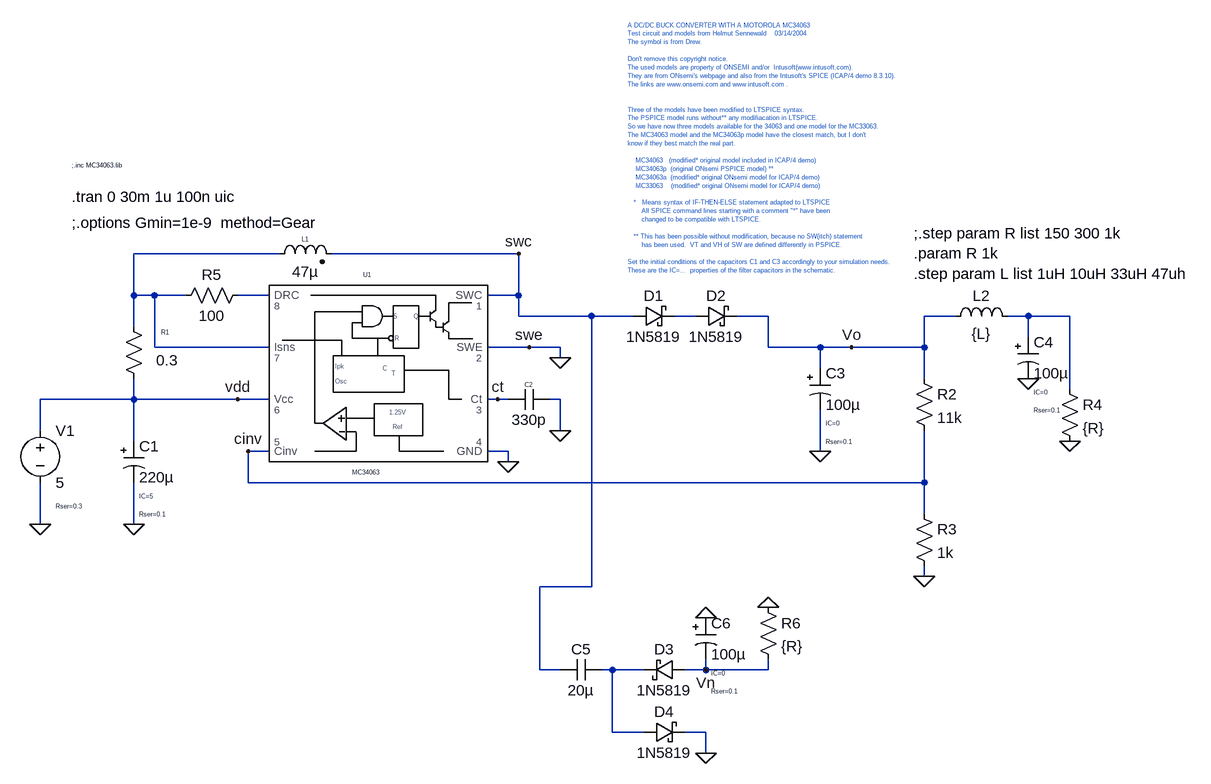
[diagram p0: schematic MC34063_boost_and_negative_rail.asc]
MC34063_boost_and_negative_rail.asc, the LTspice schematic file:
Version 4
SHEET 1 1980 852
WIRE -48 64 -272 64
WIRE 320 64 32 64
WIRE -272 128 -272 64
WIRE -240 128 -272 128
WIRE -192 128 -240 128
WIRE -64 128 -112 128
WIRE 320 128 320 64
WIRE 320 128 272 128
WIRE 320 160 320 128
WIRE 432 160 320 160
WIRE 496 160 432 160
WIRE 592 160 560 160
WIRE 704 160 656 160
WIRE 992 160 944 160
WIRE 1104 160 1072 160
WIRE 1168 160 1104 160
WIRE -272 176 -272 128
WIRE 1104 192 1104 160
WIRE -240 208 -240 128
WIRE -64 208 -240 208
WIRE 336 208 272 208
WIRE 384 208 336 208
WIRE 704 208 704 160
WIRE 784 208 704 208
WIRE 832 208 784 208
WIRE 944 208 944 160
WIRE 944 208 832 208
WIRE 384 224 384 208
WIRE 784 240 784 208
WIRE 944 256 944 208
WIRE 1168 272 1168 160
WIRE -272 288 -272 256
WIRE -272 288 -416 288
WIRE -112 288 -272 288
WIRE -64 288 -112 288
WIRE 288 288 272 288
WIRE 304 288 288 288
WIRE 384 288 368 288
WIRE -416 336 -416 288
WIRE 384 336 384 288
WIRE -272 352 -272 288
WIRE -64 368 -96 368
WIRE 304 368 272 368
WIRE 784 368 784 304
WIRE 304 384 304 368
WIRE -96 416 -96 368
WIRE 944 416 944 336
WIRE 944 416 -96 416
WIRE 944 464 944 416
WIRE -416 480 -416 416
WIRE -272 480 -272 416
WIRE 944 560 944 544
WIRE 432 576 432 160
WIRE 432 576 352 576
WIRE 352 704 352 576
WIRE 384 704 352 704
WIRE 464 704 448 704
WIRE 512 704 464 704
WIRE 608 704 608 688
WIRE 608 704 576 704
WIRE 704 704 704 688
WIRE 704 704 608 704
WIRE 464 800 464 704
WIRE 512 800 464 800
WIRE 608 800 576 800
WIRE 608 832 608 800
FLAG -416 480 0
FLAG -272 480 0
FLAG 384 336 0
FLAG 784 368 0
FLAG 832 208 Vo
FLAG 944 560 0
FLAG 304 384 0
FLAG 288 288 ct
FLAG 336 208 swe
FLAG -112 288 vdd
FLAG -96 368 cinv
FLAG 320 64 swc
FLAG 384 224 0
FLAG 1168 352 0
FLAG 1104 256 0
FLAG 608 832 0
FLAG 608 624 0
FLAG 608 704 Vn
FLAG 704 608 0
SYMBOL voltage -416 320 R0
WINDOW 123 0 0 Left 0
WINDOW 39 24 132 Left 0
SYMATTR SpiceLine Rser=0.3
SYMATTR InstName V1
SYMATTR Value 5
SYMBOL res -256 272 R180
WINDOW 0 -39 87 Left 0
WINDOW 3 -52 44 Left 2
SYMATTR InstName R1
SYMATTR Value 0.3
SYMBOL cap 304 304 R270
WINDOW 0 32 32 VTop 0
WINDOW 3 0 32 VBottom 2
SYMATTR InstName C2
SYMATTR Value 330p
SYMBOL schottky 496 176 R270
WINDOW 0 32 32 VTop 2
WINDOW 3 0 32 VBottom 2
SYMATTR InstName D1
SYMATTR Value 1N5819
SYMATTR Description Diode
SYMATTR Type diode
SYMBOL ind2 -64 80 R270
WINDOW 0 32 56 VTop 0
WINDOW 3 4 56 VBottom 2
SYMATTR InstName L1
SYMATTR Value 47µ
SYMATTR SpiceLine Rser=0.5
SYMATTR Type ind
SYMBOL res 928 240 R0
SYMATTR InstName R2
SYMATTR Value 11k
SYMBOL res 928 448 R0
SYMATTR InstName R3
SYMATTR Value 1k
SYMBOL polcap 768 240 R0
WINDOW 39 24 113 Left 0
WINDOW 40 24 85 Left 0
SYMATTR SpiceLine Rser=0.1
SYMATTR SpiceLine2 IC=0
SYMATTR InstName C3
SYMATTR Value 100µ
SYMBOL polcap -288 352 R0
WINDOW 39 24 113 Left 0
WINDOW 40 24 85 Left 0
SYMATTR SpiceLine Rser=0.1
SYMATTR SpiceLine2 IC=5
SYMATTR InstName C1
SYMATTR Value 220µ
SYMBOL MC34063 176 224 R0
SYMATTR InstName U1
SYMBOL res -96 112 R90
WINDOW 0 0 56 VBottom 2
WINDOW 3 32 56 VTop 2
SYMATTR InstName R5
SYMATTR Value 100
SYMBOL res 1152 256 R0
SYMATTR InstName R4
SYMATTR Value {R}
SYMBOL ind 976 176 R270
WINDOW 0 32 56 VTop 2
WINDOW 3 5 56 VBottom 2
SYMATTR InstName L2
SYMATTR Value {L}
SYMATTR SpiceLine Ipk=1.85 Rser=0.27 Rpar=54207.9 Cpar=0
SYMBOL polcap 1088 192 R0
WINDOW 39 24 113 Left 0
WINDOW 40 24 85 Left 0
SYMATTR SpiceLine Rser=0.1
SYMATTR SpiceLine2 IC=0
SYMATTR InstName C4
SYMATTR Value 100µ
SYMBOL schottky 592 176 R270
WINDOW 0 32 32 VTop 2
WINDOW 3 0 32 VBottom 2
SYMATTR InstName D2
SYMATTR Value 1N5819
SYMATTR Description Diode
SYMATTR Type diode
SYMBOL cap 448 688 R90
WINDOW 0 0 32 VBottom 2
WINDOW 3 32 32 VTop 2
SYMATTR InstName C5
SYMATTR Value 20µ
SYMBOL schottky 576 688 R90
WINDOW 0 0 32 VBottom 2
WINDOW 3 32 32 VTop 2
SYMATTR InstName D3
SYMATTR Value 1N5819
SYMATTR Description Diode
SYMATTR Type diode
SYMBOL schottky 512 816 R270
WINDOW 0 32 32 VTop 2
WINDOW 3 0 32 VBottom 2
SYMATTR InstName D4
SYMATTR Value 1N5819
SYMATTR Description Diode
SYMATTR Type diode
SYMBOL polcap 592 624 R0
WINDOW 39 24 113 Left 0
WINDOW 40 24 85 Left 0
SYMATTR SpiceLine Rser=0.1
SYMATTR SpiceLine2 IC=0
SYMATTR InstName C6
SYMATTR Value 100µ
SYMBOL res 688 592 R0
SYMATTR InstName R6
SYMATTR Value {R}
TEXT -368 -24 Left 2 !.tran 0 30m 1u 100n uic
TEXT -368 -72 Left 0 !;.inc MC34063.lib
TEXT -368 16 Left 2 !;.options Gmin=1e-9  method=Gear
TEXT 488 -288 Left 0 ;A DC/DC BUCK CONVERTER WITH A MOTOROLA MC34063\nTest circuit and models from Helmut Sennewald    03/14/2004\nThe symbol is from Drew.\n \nDon't remove this copyright notice.\nThe used models are property of ONSEMI and/or  Intusoft(www.intusoft.com).\nThey are from ONsemi's webpage and also from the Intusoft's SPICE (ICAP/4 demo 8.3.10).\nThe links are www.onsemi.com and www.intusoft.com .\n \n \nThree of the models have been modified to LTSPICE syntax.\nThe PSPICE model runs without** any modifiacation in LTSPICE.\nSo we have now three models available for the 34063 and one model for the MC33063. \nThe MC34063 model and the MC34063p model have the closest match, but I don't\nknow if they best match the real part.\n \n    MC34063   (modified* original model included in ICAP/4 demo)\n    MC34063p  (original ONsemi PSPICE model) **\n    MC34063a  (modified* original ONsemi model for ICAP/4 demo)\n    MC33063    (modified* original ONsemi model for ICAP/4 demo) \n \n   *   Means syntax of IF-THEN-ELSE statement adapted to LTSPICE\n       All SPICE command lines starting with a comment "*" have been \n       changed to be compatible with LTSPICE. \n      \n   ** This has been possible without modification, because no SW(itch) statement \n       has been used.  VT and VH of SW are defined differently in PSPICE.\n \nSet the initial conditions of the capacitors C1 and C3 accordingly to your simulation needs.\nThese are the IC=...  properties of the filter capacitors in the schematic.
TEXT 928 32 Left 2 !;.step param R list 150 300 1k\n.param R 1k\n.step param L list 1uH 10uH 33uH 47uh

The netlist it stands for:
* MC34063_boost_and_negative_rail.asc
V1 vdd 0 5 Rser=0.3
R1 vdd N001 0.3
C2 ct 0 330p
D1 swc N003 1N5819
L1 N001 swc 47µ Rser=0.5
R2 Vo cinv 11k
R3 cinv 0 1k
C3 Vo 0 100µ Rser=0.1 IC=0
C1 vdd 0 220µ Rser=0.1 IC=5
XU1 swc 0 ct 0 cinv vdd N001 N002 MC34063  ; pins SWC SWE Ct GND Cinv Vcc Isns DRC
R5 N002 N001 100
R4 N004 0 {R}
L2 Vo N004 {L} Ipk=1.85 Rser=0.27 Rpar=54207.9 Cpar=0
C4 N004 0 100µ Rser=0.1 IC=0
D2 N003 Vo 1N5819
C5 N005 swc 20µ
D3 Vn N005 1N5819
D4 N005 0 1N5819
C6 0 Vn 100µ Rser=0.1 IC=0
R6 0 Vn {R}
.model D D
.lib standard.dio
.tran 0 30m 1u 100n uic
;.inc MC34063.lib
;.options Gmin=1e-9  method=Gear
* A DC/DC BUCK CONVERTER WITH A MOTOROLA MC34063
* Test circuit and models from Helmut Sennewald    03/14/2004
* The symbol is from Drew.
* Don't remove this copyright notice.
* The used models are property of ONSEMI and/or  Intusoft(www.intusoft.com).
* They are from ONsemi's webpage and also from the Intusoft's SPICE (ICAP/4 demo 8.3.10).
* The links are www.onsemi.com and www.intusoft.com .
* Three of the models have been modified to LTSPICE syntax.
* The PSPICE model runs without** any modifiacation in LTSPICE.
* So we have now three models available for the 34063 and one model for the MC33063.
* The MC34063 model and the MC34063p model have the closest match, but I don't
* know if they best match the real part.
*     MC34063   (modified* original model included in ICAP/4 demo)
*     MC34063p  (original ONsemi PSPICE model) **
*     MC34063a  (modified* original ONsemi model for ICAP/4 demo)
*     MC33063    (modified* original ONsemi model for ICAP/4 demo)
*    *   Means syntax of IF-THEN-ELSE statement adapted to LTSPICE
*        All SPICE command lines starting with a comment "*" have been
*        changed to be compatible with LTSPICE.
*    ** This has been possible without modification, because no SW(itch) statement
*        has been used.  VT and VH of SW are defined differently in PSPICE.
* Set the initial conditions of the capacitors C1 and C3 accordingly to your simulation needs.
* These are the IC=...  properties of the filter capacitors in the schematic.
;.step param R list 150 300 1k
.param R 1k
.step param L list 1uH 10uH 33uH 47uh
.lib MC34063.lib
.backanno
.end